# Altium project FYP_schemetics.PrjPcb
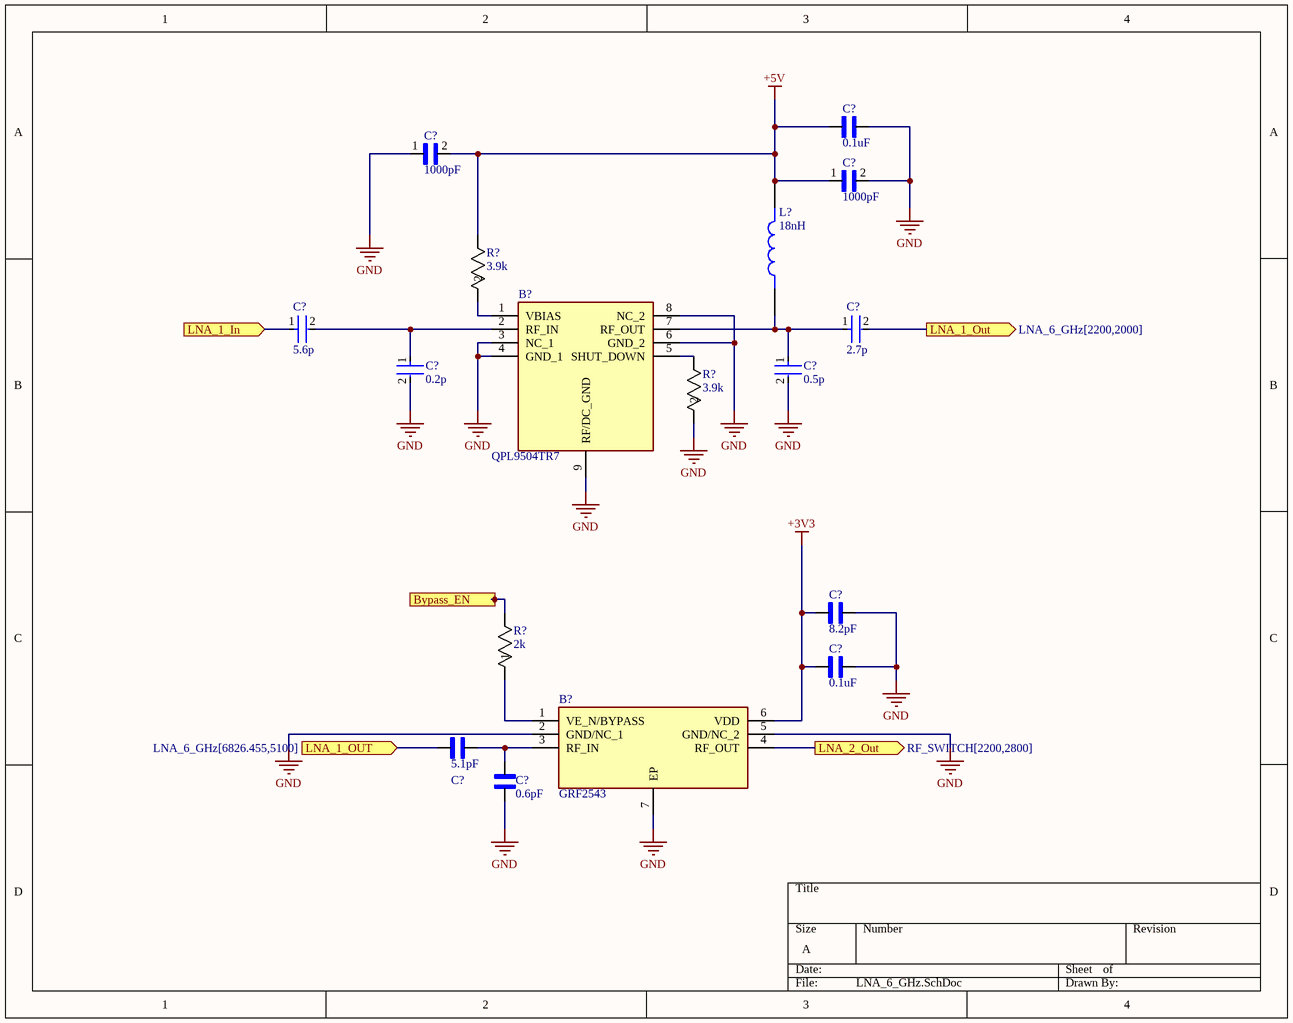
[diagram p0: LNA_6_GHz.SchDoc]
11 sheets, 127 parts. Net scope: flat (ports and power ports of the same name join across sheets).
Sheets:
  LNA_6_GHz.SchDoc
  LNA_0.8_1.6_GHz.SchDoc
  LNA_1_3_GHz.SchDoc
  RF_SWITCH.SchDoc
  IQ_DEMOD.SchDoc
  DEMOD_FILTERS.SchDoc
  IF_FILTER_AMP.SchDoc
  ADC_DRIVER.SchDoc
  ADC.SchDoc
  RF_CONNECT.SchDoc
  DIGITAL_CONNECT.SchDoc

## Sheet LNA_6_GHz.SchDoc
size A; SheetNumber: 1; SheetTotal: 11

### Parts
(Parts that share a designator on the sheet are numbered #1, #2 ... from top to bottom, then left to right.)
B?#1  QPL9504TR7  [SON50P200X200X90-9N-D]
B?#2  GRF2543  [SON50P150X150X45-7N]
C?#1  0.1uF  [CAPC1005X55N]
C?#2  1000pF  [CAPC1005X55N]
C?#3  1000pF  [CAPC1005X55N]
C?#4  5.6p  [FP-GJM155-0_05-IPC_A]
C?#5  2.7p  [FP-GJM155-0_05-IPC_A]
C?#6  0.2p  [FP-GJM155-0_05-IPC_A]
C?#7  0.5p  [FP-GJM155-0_05-IPC_A]
C?#8  8.2pF  [CAPC0603X33N]
C?#9  0.1uF  [CAPC1005X55N]
C?#10  5.1pF  [CAPC0603X33N]
C?#11  0.6pF  [CAPC0603X33N]
L?#1  18nH  [IND_0603CS-18NXJRW]
R?#1  3.9k  [RES0402_CRG_TYCO_TYC-M]
R?#2  3.9k  [RES0402_CRG_TYCO_TYC-M]
R?#3  2k  [RES_RC0201_P6XP3_YAG]

### Ports
Bypass_EN (in), LNA_1_In (in), LNA_1_OUT (in, see LNA_6_GHz[6826.455,5100]), LNA_1_Out (out, see LNA_6_GHz[2200,2000]), LNA_2_Out (out, see RF_SWITCH[2200,2800])

### Nets
+3V3: B?#2.6(VDD) C?#8.1 C?#9.1  [project net VPS]
+5V: C?#1.1 C?#2.2 C?#3.1 L?#1.2 R?#1.1
GND: B?#1.3(NC_1) B?#1.4(GND_1) B?#1.6(GND_2) B?#1.8(NC_2) B?#1.9(RF/DC_GND) B?#2.2(GND/NC_1) B?#2.5(GND/NC_2) B?#2.7(EP) C?#1.2 C?#2.1 C?#3.2 C?#6.2 C?#7.2 C?#8.2 C?#9.2 C?#11.1 R?#2.2
NetB?#1_1: B?#1.1(VBIAS) R?#1.2
NetB?#1_2: B?#1.2(RF_IN) C?#4.2 C?#6.1
NetB?#1_5: B?#1.5(SHUT_DOWN) R?#2.1
NetB?#1_7: B?#1.7(RF_OUT) C?#5.1 C?#7.1 L?#1.1
NetB?#2_1: B?#2.1(VE_N/BYPASS) R?#3.1
NetB?#2_3: B?#2.3(RF_IN) C?#10.2 C?#11.2
NetB?#2_4: B?#2.4(RF_OUT) ; port LNA_2_Out
NetC?#4_1: C?#4.1 ; port LNA_1_In
NetC?#5_2: C?#5.2 C?#10.1 ; port LNA_1_Out, port LNA_1_OUT
NetR?#3_2: R?#3.2 ; port Bypass_EN

### Library data of the parts
B?#1 = QPL9504TR7: Ultra Low Noise, Flat Gain LNA; Manufacturer_Name: Qorvo; Geometry.Height: 0.9mm; Manufacturer_Part_Number: QPL9504TR7; Mouser Part Number: 772-QPL9504TR7; Mouser Price/Stock: https://www.mouser.co.uk/ProductDetail/Qorvo/QPL9504TR7?qs=iLbezkQI%252BsiSWi8SJWi3jA%3D%3D; Arrow Part Number: *; Arrow Price/Stock: *; Datasheet Link: https://www.qorvo.com/products/d/da007934; Supplier: Avnet; Supplier Part Number: GJM1555C1H5R6CB01D
B?#2 = GRF2543: RF Amplifier High Gain, LNA with Bypass; IEEE 802.11 a/n/ac/p, 4.9 - 6.0 GHz; Manufacturer_Name: Guerrilla RF; Geometry.Height: 0.45mm; Mouser Part Number: 459-GRF2543; Mouser Price/Stock: https://www.mouser.co.uk/ProductDetail/Guerrilla-RF/GRF2543?qs=PqoDHHvF64%2FihZz%2FtUpOTQ%3D%3D; Manufacturer_Part_Number: GRF2543; Datasheet Link: https://www.guerrilla-rf.com/products/DataSheet?sku=2543&file_name=GRF2543DS.pdf
C?#1 = GRM155R61A104KA01J: 0402 0.1 uF 10 V Â±10% Tolerance X5R SMT Multilayer Ceramic Capacitor; MF: Murata Electronics; SnapEDA_Link: https://www.snapeda.com/parts/GRM155R61A104KA01J/Murata+Electronics+North+America/view-part/?ref=snap; Package: 1005-2 Murata; Value: *; MP: GRM155R61A104KA01J; Check_prices: https://www.snapeda.com/parts/GRM155R61A104KA01J/Murata+Electronics+North+America/view-part/?ref=eda
C?#2 C?#3 = C1005X7R1H102K050BA: 1000 pF Â±10% 50V Ceramic Capacitor X7R 0402 (1005 Metric); MF: TDK; Purchase-URL: https://pricing.snapeda.com/search/part/C1005X7R1H102K050BA/?ref=eda; Package: 1005 TDK; MP: C1005X7R1H102K050BA; Digi-Key_Part_Number: 445-1256-2-ND; Value: *; Check_prices: https://www.snapeda.com/parts/C1005X7R1H102K050BA/TDK/view-part/?ref=eda; SnapEDA_Link: https://www.snapeda.com/parts/C1005X7R1H102K050BA/TDK/view-part/?ref=snap
C?#4 = CMP-2008-03866-2-5.6p: Multi-Layer Ceramic Capacitor 5.6pF C0G  ±0.25pF 0402 Paper T/R; Voltage Rating: 50V; Lead Free: Lead Free; Radiation Hardening: No; Termination: SMD/SMT; Width: 0.02inch; Capacitance: 5.6pF; Thickness: 0.022inch; Depth: 0.5mm; Max Operating Temperature: 125°C; Package Quantity: 1; Case Code (Imperial): 0402; Case Code (Metric): 1005; Mount: Surface Mount; Voltage: 50V; Packaging: Tape and Reel; Length: 1mm; Voltage Rating (DC): 50V; Case/Package: 0402; Dielectric: C0G; Min Operating Temperature: -55°C; Height: 0.5mm
C?#5 = CMP-2008-03841-2-2.7p: Multi-Layer Ceramic Capacitor 2.7pF C0G  ±0.25pF 0402 Paper T/R; Voltage: 50V; Insulation Resistance: 10GR; Lead Free: Lead Free; Case Code (Metric): 1005; Min Operating Temperature: -55°C; Case Code (Imperial): 0402; Max Operating Temperature: 125°C; Thickness: 0.022inch; Voltage Rating (DC): 50V; Package Quantity: 1; Termination: SMD/SMT; Dielectric: C0G; Case/Package: 0402; Length: 1mm; Mount: Surface Mount; Height: 0.5mm; Voltage Rating: 50V; Radiation Hardening: No; Width: 0.02inch; Depth: 0.5mm; Packaging: Tape and Reel; Capacitance: 2.7pF
C?#6 = CMP-2008-03898-2-0.2p: Multi-Layer Ceramic Capacitor 0.2pF C0G  ±0.1pF 0402 Paper T/R; Voltage Rating (DC): 50V; Packaging: Tape and Reel; REACH SVHC: No SVHC; Mount: Surface Mount; Thickness: 0.022inch; Height: 0.5mm; Package Quantity: 1; Depth: 0.5mm; Max Operating Temperature: 125°C; Case Code (Imperial): 0402; Number of Pins: 2; Termination: SMD/SMT; Min Operating Temperature: -55°C; Lead Pitch: 0.3mm; Width: 0.5mm; Radiation Hardening: No; Length: 1mm; Voltage Rating: 50V; Dielectric: C0G; Case/Package: 0402; Capacitance: 0.2pF; Lead Free: Lead Free; Case Code (Metric): 1005
C?#7 = CMP-2008-03904-2-0.5p: Multi-Layer Ceramic Capacitor 0.5pF C0G  ±0.1pF 0402 Paper T/R; Voltage Rating (DC): 50V; Temperature Coefficient: 30ppm/°C; Lead Pitch: 0.3mm; Max Operating Temperature: 125°C; Thickness: 0.022inch; Termination: SMD/SMT; Depth: 0.5mm; Height: 0.5mm; Voltage Rating: 50V; Length: 1mm; Case/Package: 0402; Radiation Hardening: No; Min Operating Temperature: -55°C; Width: 0.02inch; Voltage: 50V; Number of Pins: 2; REACH SVHC: No SVHC; Case Code (Imperial): 0402; Package Quantity: 1; Mount: Surface Mount; Capacitance: 0.5pF; Dielectric: C0G; Lead Free: Lead Free; Case Code (Metric): 1005; Packaging: Tape and Reel
C?#8 = GJM0335C1H8R2BB01D-8.2p: SMD capacitor C0G(EIA) with capacitance 8.2pF Tol.0.1pF. Rated voltage 50Vdc 125C; MF: Murata Electronics; SnapEDA_Link: https://www.snapeda.com/parts/GJM0335C1H8R2BB01D/Murata/view-part/?ref=snap; Package: 0603 Taiyo Yuden; Value: *; MP: GJM0335C1H8R2BB01D; Check_prices: https://www.snapeda.com/parts/GJM0335C1H8R2BB01D/Murata/view-part/?ref=eda
C?#9 = GRM155R61A104KA01J-0.1u: 0402 0.1 uF 10 V Â±10% Tolerance X5R SMT Multilayer Ceramic Capacitor; MF: Murata Electronics; SnapEDA_Link: https://www.snapeda.com/parts/GRM155R61A104KA01J/Murata+Electronics+North+America/view-part/?ref=snap; Package: 1005-2 Murata; Value: *; MP: GRM155R61A104KA01J; Check_prices: https://www.snapeda.com/parts/GRM155R61A104KA01J/Murata+Electronics+North+America/view-part/?ref=eda
C?#10 = GJM0335C1H5R1WB01D-5.1p: SMD capacitor C0G(EIA) with capacitance 5.1pF Tol.0.05pF. Rated voltage 50Vdc 125C; MF: Murata; SnapEDA_Link: https://www.snapeda.com/parts/GJM0335C1H5R1WB01D/Murata/view-part/?ref=snap; Package: 0603 Taiyo Yuden; Value: *; MP: GJM0335C1H5R1WB01D; Check_prices: https://www.snapeda.com/parts/GJM0335C1H5R1WB01D/Murata/view-part/?ref=eda
C?#11 = GJM0335C1HR60WB01D-0.6p: SMD capacitor C0G(EIA) with capacitance 0.60pF Tol.0.05pF. Rated voltage 50Vdc 125C; MF: Murata; SnapEDA_Link: https://www.snapeda.com/parts/GJM0335C1HR60WB01D/Murata/view-part/?ref=snap; Package: 0603 Taiyo Yuden; Value: *; MP: GJM0335C1HR60WB01D; Check_prices: https://www.snapeda.com/parts/GJM0335C1HR60WB01D/Murata/view-part/?ref=eda
L?#1 = 0603CS-18NXJRW: Package: None; Price: None; Value: *; MP: 0603CS-18NXJRW; Availability: Unavailable
R?#1 R?#2 = CRG0402F3K9: CRG0402 1% 3K9; Manufacturer_Name: TE Connectivity; Copyright: Copyright (C) 2026 Ultra Librarian. All rights reserved.; Manufacturer_Part_Number: CRG0402F3K9
R?#3 = RC0201JR-072KL: No Description Available; Manufacturer_Name: Yageo; Copyright: Copyright (C) 2026 Ultra Librarian. All rights reserved.; Manufacturer_Part_Number: RC0201JR-072KL

## Sheet LNA_0.8_1.6_GHz.SchDoc
size A; SheetNumber: 2; SheetTotal: 11
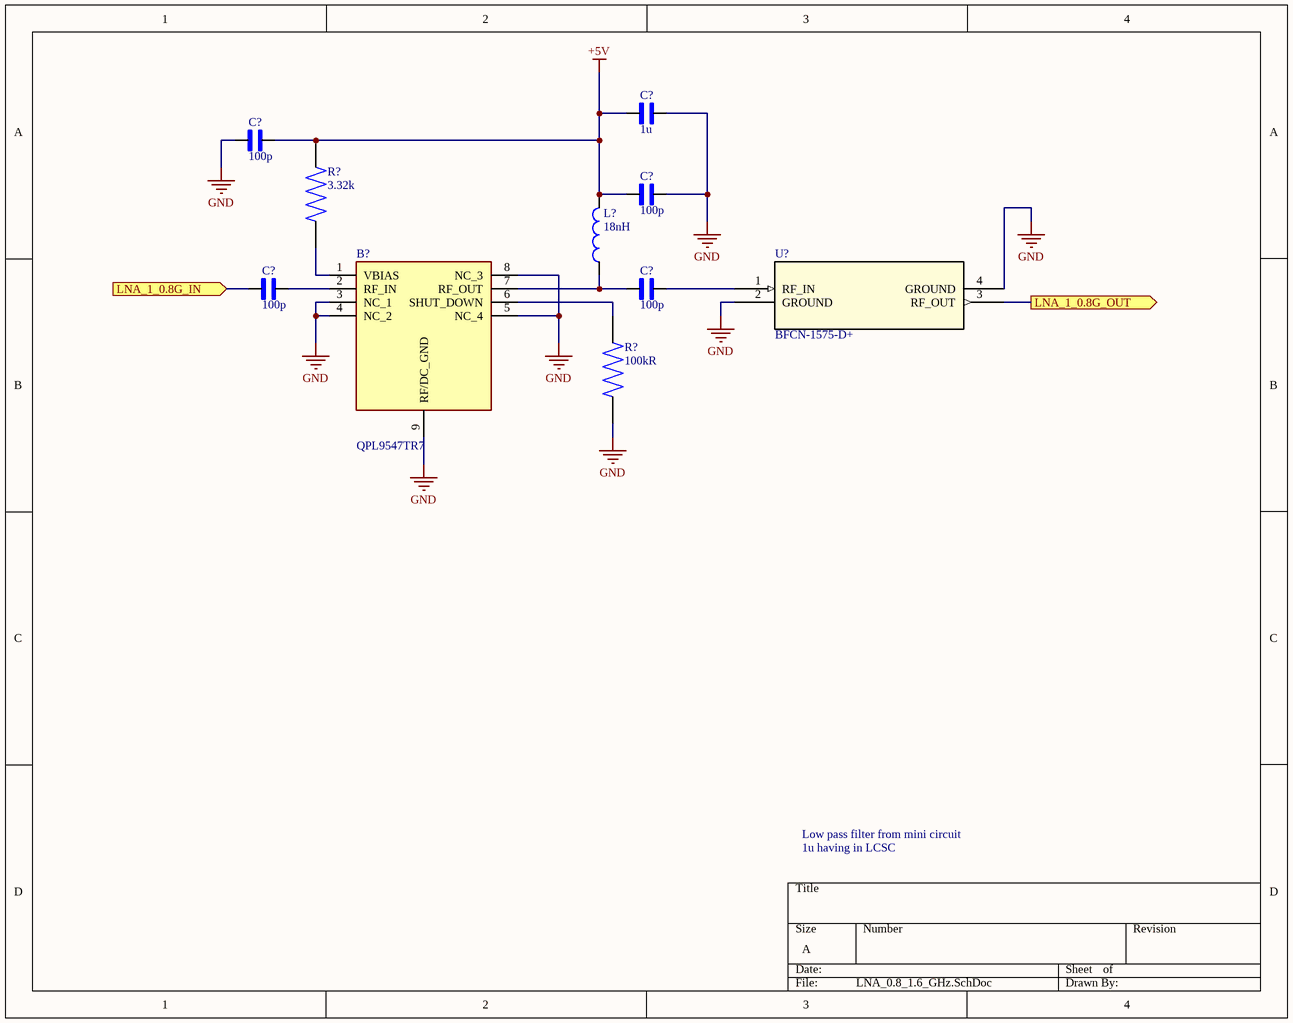
[diagram p1: LNA_0.8_1.6_GHz.SchDoc]

### Parts
(Parts that share a designator on the sheet are numbered #1, #2 ... from top to bottom, then left to right.)
B?#3  QPL9547TR7  [SON50P200X200X90-9N-D]
C?#12  1u  [CAPC1005X60N]
C?#13  100p  [CAPC1005X55N]
C?#14  100p  [CAPC1005X55N]
C?#15  100p  [CAPC1005X55N]
C?#16  100p  [CAPC1005X55N]
L?#2  18nH  [IND_0402CS-18NXGRW]
R?#4  3.32k  [RESC1005X40N]
R?#5  100kR  [RESC1005X35N]
U?#1  BFCN-1575-D+  [FV1206_MNC]

### Ports
LNA_1_0.8G_IN (in), LNA_1_0.8G_OUT (out)

### Nets
+5V: C?#12.1 C?#13.2 C?#14.1 L?#2.2 R?#4.2
GND: B?#3.3(NC_1) B?#3.4(NC_2) B?#3.5(NC_4) B?#3.8(NC_3) B?#3.9(RF/DC_GND) C?#12.2 C?#13.1 C?#14.2 R?#5.1 U?#1.2(GROUND) U?#1.4(GROUND)
NetB?#3_1: B?#3.1(VBIAS) R?#4.1
NetB?#3_2: B?#3.2(RF_IN) C?#15.2
NetB?#3_6: B?#3.6(SHUT_DOWN) R?#5.2
NetB?#3_7: B?#3.7(RF_OUT) C?#16.1 L?#2.1
NetC?#15_1: C?#15.1 ; port LNA_1_0.8G_IN
NetC?#16_2: C?#16.2 U?#1.1(RF_IN)
NetU?#1_3: U?#1.3(RF_OUT) ; port LNA_1_0.8G_OUT

### Notes on the sheet
- Low pass filter from mini circuit
- 1u having in LCSC

### Library data of the parts
B?#3 = QPL9547TR7: Ultra Low Noise, Flat Gain LNA; Manufacturer_Name: Qorvo; Geometry.Height: 0.9mm; Manufacturer_Part_Number: QPL9547TR7; Mouser Part Number: 772-QPL9504TR7; Mouser Price/Stock: https://www.mouser.com/en/ProductDetail/Qorvo/QPL9547TR7?qs=7MVldsJ5UaxZMCnAEuCHXA%3D%3D; Arrow Part Number: *; Arrow Price/Stock: *; Datasheet Link: https://www.qorvo.com/products/r/ra006121
C?#12 = GRM155C81E105KE11J-1u: SMD Capacitor X6S(EIA) with Capacitance: 1.0uF Tol. 10%. Rated Voltage: 25Vdc 402; MF: Murata; SnapEDA_Link: https://www.snapeda.com/parts/GRM155C81E105KE11J/Murata/view-part/?ref=snap; Package: 2012 Murata; Value: *; MP: GRM155C81E105KE11J; Check_prices: https://www.snapeda.com/parts/GRM155C81E105KE11J/Murata/view-part/?ref=eda
C?#13-C?#16 = UMK105CG101JV-F-100p: 100 pF Â±5% 50V Ceramic Capacitor C0G, NP0 0402 (1005 Metric); MANUFACTURER: Taiyo Yuden; Package: 1005 Taiyo Yuden; MPN: UMK105CG101JV-F; DATASHEET_URL: https://ds.yuden.co.jp/TYCOMPAS/ut/detail?pn=UMK105CG101JV-F  &u=M; Value: *; SOURCE_URL: https://www.snapeda.com/parts/UMK105CG101JV-F/Taiyo+Yuden/view-part/
L?#2 = 0402CS-18NXGRW: Package: None; Price: None; Value: *; MP: 0402CS-18NXGRW; Availability: Unavailable
R?#4 = ERJ-2RKF3321X-3.32kR: 3.32K OHM 1% 100PPM; Package: None; Price: None; Value: *; MP: ERJ-2RKF3321X; Availability: Unavailable
R?#5 = RNCF0402BKE100K-100kR: MPN: RNCF0402BKE100K; Value: *
U?#1 = BFCN-1575-D+: DC to 1575 MHz from Mini Circuit; Manufacturer_Name: Mini Circuits; Manufacturer_Part_Number: BFCN-1575+; Copyright: Copyright (C) 2026 Ultra Librarian. All rights reserved.; RefDes: RefDes; Type: Type

## Sheet LNA_1_3_GHz.SchDoc
size A; SheetNumber: 3; SheetTotal: 11
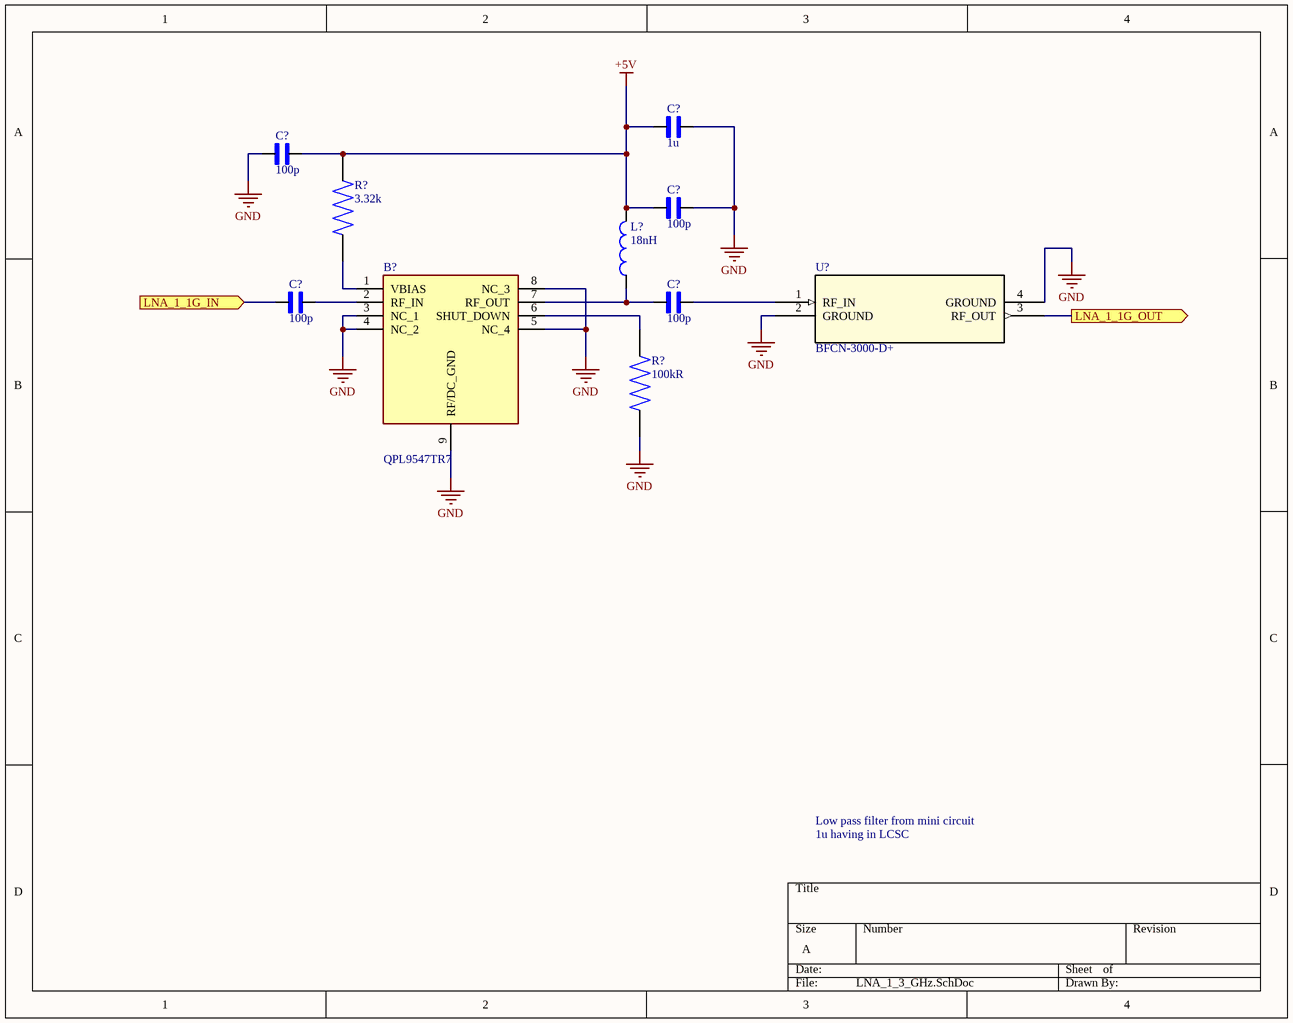
[diagram p2: LNA_1_3_GHz.SchDoc]

### Parts
(Parts that share a designator on the sheet are numbered #1, #2 ... from top to bottom, then left to right.)
B?#4  QPL9547TR7  [SON50P200X200X90-9N-D]
C?#17  1u  [CAPC1005X60N]
C?#18  100p  [CAPC1005X55N]
C?#19  100p  [CAPC1005X55N]
C?#20  100p  [CAPC1005X55N]
C?#21  100p  [CAPC1005X55N]
L?#3  18nH  [IND_0402CS-18NXGRW]
R?#6  3.32k  [RESC1005X40N]
R?#7  100kR  [RESC1005X35N]
U?#2  BFCN-3000-D+  [FV1206_MNC]

### Ports
LNA_1_1G_IN (in), LNA_1_1G_OUT (out)

### Nets
+5V: C?#17.1 C?#18.2 C?#19.1 L?#3.2 R?#6.2
GND: B?#4.3(NC_1) B?#4.4(NC_2) B?#4.5(NC_4) B?#4.8(NC_3) B?#4.9(RF/DC_GND) C?#17.2 C?#18.1 C?#19.2 R?#7.1 U?#2.2(GROUND) U?#2.4(GROUND)
NetB?#4_1: B?#4.1(VBIAS) R?#6.1
NetB?#4_2: B?#4.2(RF_IN) C?#20.2
NetB?#4_6: B?#4.6(SHUT_DOWN) R?#7.2
NetB?#4_7: B?#4.7(RF_OUT) C?#21.1 L?#3.1
NetC?#20_1: C?#20.1 ; port LNA_1_1G_IN
NetC?#21_2: C?#21.2 U?#2.1(RF_IN)
NetU?#2_3: U?#2.3(RF_OUT) ; port LNA_1_1G_OUT

### Notes on the sheet
- Low pass filter from mini circuit
- 1u having in LCSC

### Library data of the parts
B?#4 = QPL9547TR7: as B?#3 on sheet LNA_0.8_1.6_GHz; Manufacturer_Part_Number: QPL9547TR7; Mouser Part Number: 772-QPL9504TR7; Mouser Price/Stock: https://www.mouser.com/en/ProductDetail/Qorvo/QPL9547TR7?qs=7MVldsJ5UaxZMCnAEuCHXA%3D%3D; Arrow Part Number: *; Arrow Price/Stock: *; Datasheet Link: https://www.qorvo.com/products/r/ra006121
C?#17 = GRM155C81E105KE11J-1u: as C?#12 on sheet LNA_0.8_1.6_GHz; SnapEDA_Link: https://www.snapeda.com/parts/GRM155C81E105KE11J/Murata/view-part/?ref=snap; Package: 2012 Murata; Value: *; MP: GRM155C81E105KE11J; Check_prices: https://www.snapeda.com/parts/GRM155C81E105KE11J/Murata/view-part/?ref=eda
C?#18-C?#21 = UMK105CG101JV-F-100p: as C?#13 on sheet LNA_0.8_1.6_GHz; Package: 1005 Taiyo Yuden; MPN: UMK105CG101JV-F; DATASHEET_URL: https://ds.yuden.co.jp/TYCOMPAS/ut/detail?pn=UMK105CG101JV-F  &u=M; Value: *; SOURCE_URL: https://www.snapeda.com/parts/UMK105CG101JV-F/Taiyo+Yuden/view-part/
L?#3 = 0402CS-18NXGRW: Package: None; Price: None; Value: *; MP: 0402CS-18NXGRW; Availability: Unavailable
R?#6 = ERJ-2RKF3321X-3.32kR: 3.32K OHM 1% 100PPM; Package: None; Price: None; Value: *; MP: ERJ-2RKF3321X; Availability: Unavailable
R?#7 = RNCF0402BKE100K-100kR: MPN: RNCF0402BKE100K; Value: *
U?#2 = BFCN-3000-D+: DC to 3000MHz from mini circuit; Manufacturer_Name: Mini Circuits; Manufacturer_Part_Number: BFCN-1575+; Copyright: Copyright (C) 2026 Ultra Librarian. All rights reserved.; RefDes: RefDes; Type: Type

## Sheet RF_SWITCH.SchDoc
size A; SheetNumber: 5; SheetTotal: 12
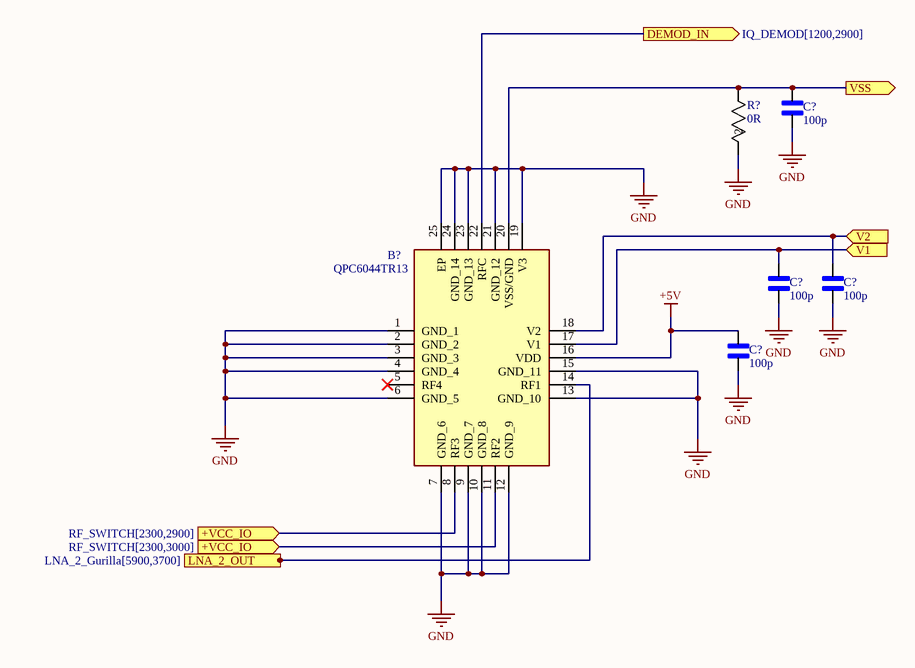
[diagram p3: RF_SWITCH.SchDoc]

### Parts
(Parts that share a designator on the sheet are numbered #1, #2 ... from top to bottom, then left to right.)
B?#5  QPC6044TR13  [QFN50P400X400X80-25N-D]
C?#22  100p  [CAPC1005X55N]
C?#23  100p  [CAPC1005X55N]
C?#24  100p  [CAPC1005X55N]
C?#25  100p  [CAPC1005X55N]
R?#8  0R  [RC0402N_PAN]

### Ports
+VCC_IO (in, see RF_SWITCH[2300,2900]), +VCC_IO (in, see RF_SWITCH[2300,3000]), DEMOD_IN (out, see IQ_DEMOD[1200,2900]), LNA_2_OUT (in, see LNA_2_Gurilla[5900,3700]), V1 (in), V2 (in), VSS (out)

### Nets
+5V: B?#5.16(VDD) C?#25.2
GND: B?#5.1(GND_1) B?#5.2(GND_2) B?#5.3(GND_3) B?#5.4(GND_4) B?#5.6(GND_5) B?#5.7(GND_6) B?#5.9(GND_7) B?#5.10(GND_8) B?#5.12(GND_9) B?#5.13(GND_10) B?#5.15(GND_11) B?#5.19(V3) B?#5.21(GND_12) B?#5.23(GND_13) B?#5.24(GND_14) B?#5.25(EP) C?#22.1 C?#23.1 C?#24.1 C?#25.1 R?#8.2
NetB?#2_4: B?#5.14(RF1) ; port LNA_2_OUT
NetB?#5_8: B?#5.8(RF3) B?#5.11(RF2) ; port +VCC_IO
NetB?#5_17: B?#5.17(V1) C?#23.2 ; port V1
NetB?#5_18: B?#5.18(V2) C?#24.2 ; port V2
NetB?#5_20: B?#5.20(VSS/GND) C?#22.2 R?#8.1 ; port VSS
NetB?#5_22: B?#5.22(RFC) ; port DEMOD_IN

Not connected (* = marked no-connect by the designer): B?#5 5(RF4)*

### Library data of the parts
B?#5 = QPC6044TR13: 5 - 6000 MHz Absorptive High Isolation SP4T Switch; Manufacturer_Name: Qorvo; Geometry.Height: 0.8mm; Mouser Part Number: 772-QPC6044TR; Mouser Price/Stock: https://www.mouser.co.uk/ProductDetail/Qorvo/QPC6044TR13?qs=AZxAKFb3YN%252BZtJBrTRUA2g%3D%3D; Manufacturer_Part_Number: QPC6044TR13; Datasheet Link: https://www.qorvo.com/products/d/da000272
C?#22-C?#25 = UMK105CG101JV-F-100p: as C?#13 on sheet LNA_0.8_1.6_GHz; Package: 1005 Taiyo Yuden; MPN: UMK105CG101JV-F; DATASHEET_URL: https://ds.yuden.co.jp/TYCOMPAS/ut/detail?pn=UMK105CG101JV-F  &u=M; Value: *; SOURCE_URL: https://www.snapeda.com/parts/UMK105CG101JV-F/Taiyo+Yuden/view-part/
R?#8 = ERJ-2GE0R00X-0R: RESISTOR; 0402; 0 OHM; 0%; JUMPER; 0.10W; THICK FILM; Manufacturer_Name: Panasonic; Copyright: Copyright (C) 2025 Ultra Librarian. All rights reserved.; Manufacturer_Part_Number: ERJ-2GE0R00X

## Sheet IQ_DEMOD.SchDoc
size A; SheetNumber: 6; SheetTotal: 12
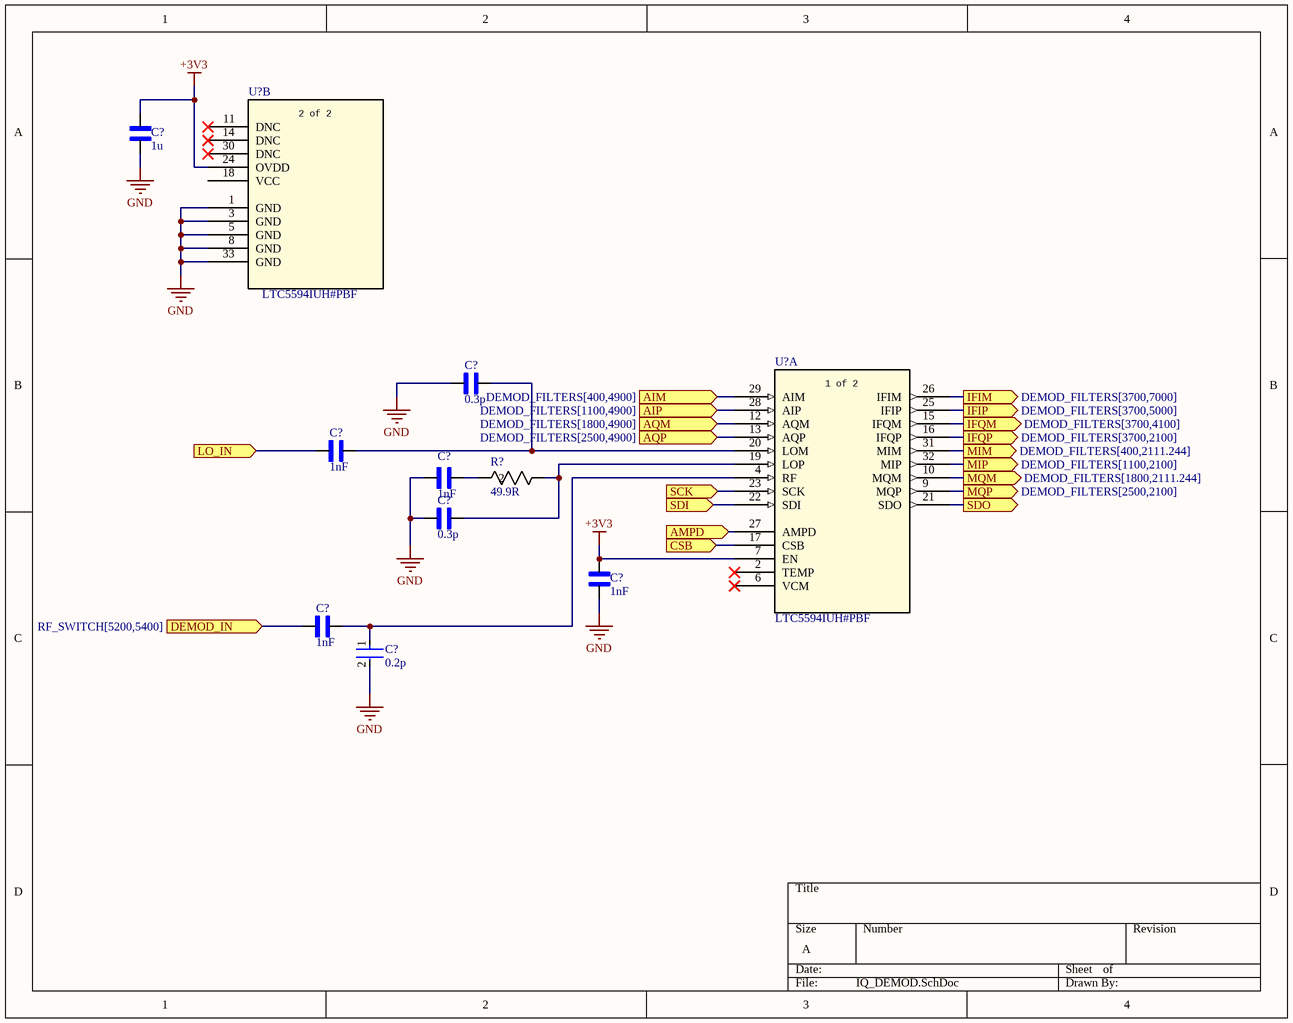
[diagram p4: IQ_DEMOD.SchDoc]

### Parts
(Parts that share a designator on the sheet are numbered #1, #2 ... from top to bottom, then left to right.)
C?#26  1u  [CAPC1608X90N]
C?#27  0.3p  [CAPC1005X55N]
C?#28  1nF  [CAPC1005X55N]
C?#29  1nF  [CAPC1005X55N]
C?#30  0.3p  [CAPC1005X55N]
C?#31  1nF  [CAPC1005X55N]
C?#32  1nF  [CAPC1005X55N]
C?#33  0.2p  [FP-GJM155-0_05-IPC_A]
R?#9  49.9R  [RC0402N_YAG]
U?#3  LTC5594IUH#PBF  [UH_05-08-1693_ADI]  (part B of 2)
U?#4  LTC5594IUH#PBF  [UH_05-08-1693_ADI]  (part A of 2)

### Ports
AIM (in, see DEMOD_FILTERS[400,4900]), AIP (in, see DEMOD_FILTERS[1100,4900]), AMPD (in), AQM (in, see DEMOD_FILTERS[1800,4900]), AQP (in, see DEMOD_FILTERS[2500,4900]), CSB (in), DEMOD_IN (in, see RF_SWITCH[5200,5400]), IFIM (out, see DEMOD_FILTERS[3700,7000]), IFIP (out, see DEMOD_FILTERS[3700,5000]), IFQM (out, see DEMOD_FILTERS[3700,4100]), IFQP (out, see DEMOD_FILTERS[3700,2100]), LO_IN (in), MIM (out, see DEMOD_FILTERS[400,2111.244]), MIP (out, see DEMOD_FILTERS[1100,2100]), MQM (out, see DEMOD_FILTERS[1800,2111.244]), MQP (out, see DEMOD_FILTERS[2500,2100]), SCK (in), SDI (in), SDO (out)

### Nets
+3V3: C?#26.2 C?#31.2 U?#3.24(OVDD) U?#4.7(EN)  [project net VPS]
GND: C?#26.1 C?#27.1 C?#29.1 C?#30.1 C?#31.1 C?#33.2 U?#3.1(GND) U?#3.3(GND) U?#3.5(GND) U?#3.8(GND) U?#3.33(GND)
NetB?#5_22: C?#32.1 ; port DEMOD_IN
NetC?#27_2: C?#27.2 C?#28.2 U?#4.20(LOM)
NetC?#28_1: C?#28.1 ; port LO_IN
NetC?#29_2: C?#29.2 R?#9.2
NetC?#30_2: C?#30.2 R?#9.1 U?#4.19(LOP)
NetC?#32_2: C?#32.2 C?#33.1 U?#4.4(RF)
NetC?#34_2: U?#4.26(IFIM) ; port IFIM
NetC?#37_1: U?#4.25(IFIP) ; port IFIP
NetC?#40_1: U?#4.29(AIM) ; port AIM
NetC?#41_2: U?#4.28(AIP) ; port AIP
NetC?#42_1: U?#4.12(AQM) ; port AQM
NetC?#43_2: U?#4.13(AQP) ; port AQP
NetC?#44_2: U?#4.15(IFQM) ; port IFQM
NetC?#47_1: U?#4.31(MIM) ; port MIM
NetC?#48_2: U?#4.32(MIP) ; port MIP
NetC?#49_1: U?#4.10(MQM) ; port MQM
NetC?#50_2: U?#4.9(MQP) ; port MQP
NetC?#51_1: U?#4.16(IFQP) ; port IFQP
NetU?#4_17: U?#4.17(CSB) ; port CSB
NetU?#4_21: U?#4.21(SDO) ; port SDO
NetU?#4_22: U?#4.22(SDI) ; port SDI
NetU?#4_23: U?#4.23(SCK) ; port SCK
NetU?#4_27: U?#4.27(AMPD) ; port AMPD

Not connected (* = marked no-connect by the designer): U?#3 11(DNC)* 14(DNC)* 18(VCC) 30(DNC)*; U?#4 2(TEMP)* 6(VCM)*

### Notes on the sheet
- (in symbol LTC5594IUHPBF, part A) 1 of 2
- (in symbol LTC5594IUHPBF, part B) 2 of 2

### Library data of the parts
C?#26 = GCM188R71E105KA64J-1u: 1 ÂµF Â±10% 25V Ceramic Capacitor X7R 0603 (1608 Metric); MF: Murata; SnapEDA_Link: https://www.snapeda.com/parts/GCM188R71E105KA64J/Murata/view-part/?ref=snap; Package: 1608-2 MURATA; Value: *; MP: GCM188R71E105KA64J; Check_prices: https://www.snapeda.com/parts/GCM188R71E105KA64J/Murata/view-part/?ref=eda
C?#27 C?#30 = GJM1555C1HR30WB01D-0.3p: 0402 0.3 pF 50V Â±0.05 pF Tolerance C0G SMT Multilayer Ceramic Capacitor; MF: Murata; SnapEDA_Link: https://www.snapeda.com/parts/GJM1555C1HR30WB01D/Murata/view-part/?ref=snap; Package: 1005 Taiyo Yuden; Value: *; MP: GJM1555C1HR30WB01D; Check_prices: https://www.snapeda.com/parts/GJM1555C1HR30WB01D/Murata/view-part/?ref=eda
C?#28 C?#29 C?#31 C?#32 = GRM1555C1H102FA01D-1n: SMD capacitor C0G(EIA) with capacitance 1000pF Tol.1%. Rated voltage 50Vdc 125C; MF: Murata; SnapEDA_Link: https://www.snapeda.com/parts/GRM1555C1H102FA01D/Murata/view-part/?ref=snap; Package: 1005-2 Murata; Value: *; MP: GRM1555C1H102FA01D; Check_prices: https://www.snapeda.com/parts/GRM1555C1H102FA01D/Murata/view-part/?ref=eda
C?#33 = CMP-2008-03898-2-0.2p: as C?#6 on sheet LNA_6_GHz; Packaging: Tape and Reel; REACH SVHC: No SVHC; Mount: Surface Mount; Thickness: 0.022inch; Height: 0.5mm; Package Quantity: 1; Depth: 0.5mm; Max Operating Temperature: 125°C; Case Code (Imperial): 0402; Number of Pins: 2; Termination: SMD/SMT; Min Operating Temperature: -55°C; Lead Pitch: 0.3mm; Width: 0.5mm; Radiation Hardening: No; Length: 1mm; Voltage Rating: 50V; Dielectric: C0G; Case/Package: 0402; Capacitance: 0.2pF; Lead Free: Lead Free; Case Code (Metric): 1005
R?#9 = RC0402FR-0749R9L-49.9R: RES, 49.9, 1%, 0.063 W, 0402; Manufacturer_Name: Yageo; Copyright: Copyright (C) 2025 Ultra Librarian. All rights reserved.; Manufacturer_Part_Number: RC0402FR-0749R9L
U?#3 U?#4 = LTC5594IUHPBF: 300MHz to 9GHz High Linearity I/Q Demodulator with Wideband IF Amplifier; Manufacturer_Name: Analog Devices Inc; Copyright: Copyright (C) 2026 Ultra Librarian. All rights reserved.; Manufacturer_Part_Number: LTC5594IUH#PBF; RefDes: RefDes; Type: Type

## Sheet DEMOD_FILTERS.SchDoc
size A; SheetNumber: 4; SheetTotal: 9
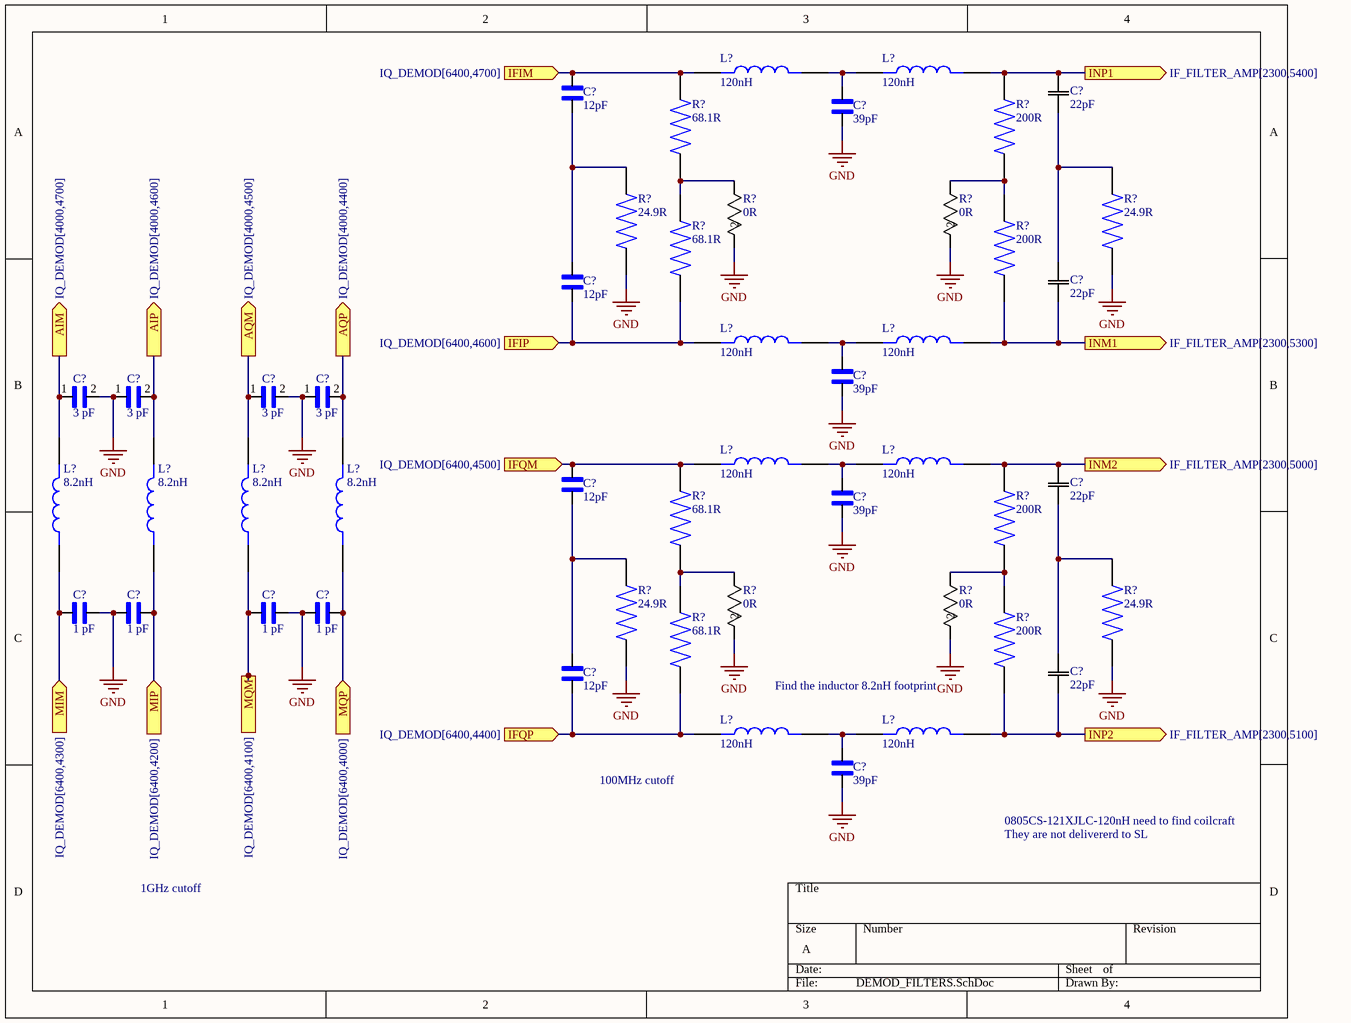
[diagram p5: DEMOD_FILTERS.SchDoc]

### Parts
(Parts that share a designator on the sheet are numbered #1, #2 ... from top to bottom, then left to right.)
C?#34  12pF  [CAPC1005X55N]
C?#35  39pF  [CAPC1005X55N]
C?#36  22pF  [G-155_MUR]
C?#37  12pF  [CAPC1005X55N]
C?#38  22pF  [G-155_MUR]
C?#39  39pF  [CAPC1005X55N]
C?#40  3 pF  [CAPC0603X33N]
C?#41  3 pF  [CAPC0603X33N]
C?#42  3 pF  [CAPC0603X33N]
C?#43  3 pF  [CAPC0603X33N]
C?#44  12pF  [CAPC1005X55N]
C?#45  39pF  [CAPC1005X55N]
C?#46  22pF  [G-155_MUR]
C?#47  1 pF  [CAPC0603X33N]
C?#48  1 pF  [CAPC0603X33N]
C?#49  1 pF  [CAPC0603X33N]
C?#50  1 pF  [CAPC0603X33N]
C?#51  12pF  [CAPC1005X55N]
C?#52  22pF  [G-155_MUR]
C?#53  39pF  [CAPC1005X55N]
L?#4  120nH
L?#5  120nH
L?#6  120nH
L?#7  120nH
L?#8  120nH
L?#9  120nH
L?#10  8.2nH
L?#11  8.2nH
L?#12  8.2nH
L?#13  8.2nH
L?#14  120nH
L?#15  120nH
R?#10  68.1R  [RESC1005X40N]
R?#11  200R  [RESC1005X40N]
R?#12  24.9R  [RESC1005X40N]
R?#13  24.9R  [RESC1005X40N]
R?#14  68.1R  [RESC1005X40N]
R?#15  0R  [RC0402N_PAN]
R?#16  0R  [RC0402N_PAN]
R?#17  200R  [RESC1005X40N]
R?#18  68.1R  [RESC1005X40N]
R?#19  200R  [RESC1005X40N]
R?#20  24.9R  [RESC1005X40N]
R?#21  24.9R  [RESC1005X40N]
R?#22  68.1R  [RESC1005X40N]
R?#23  0R  [RC0402N_PAN]
R?#24  0R  [RC0402N_PAN]
R?#25  200R  [RESC1005X40N]

### Ports
AIM (out, see IQ_DEMOD[4000,4700]), AIP (out, see IQ_DEMOD[4000,4600]), AQM (out, see IQ_DEMOD[4000,4500]), AQP (out, see IQ_DEMOD[4000,4400]), IFIM (in, see IQ_DEMOD[6400,4700]), IFIP (in, see IQ_DEMOD[6400,4600]), IFQM (in, see IQ_DEMOD[6400,4500]), IFQP (in, see IQ_DEMOD[6400,4400]), INM1 (out, see IF_FILTER_AMP[2300,5300]), INM2 (out, see IF_FILTER_AMP[2300,5000]), INP1 (out, see IF_FILTER_AMP[2300,5400]), INP2 (out, see IF_FILTER_AMP[2300,5100]), MIM (in, see IQ_DEMOD[6400,4300]), MIP (in, see IQ_DEMOD[6400,4200]), MQM (in, see IQ_DEMOD[6400,4100]), MQP (in, see IQ_DEMOD[6400,4000])

### Nets
GND: C?#35.1 C?#39.1 C?#40.2 C?#41.1 C?#42.2 C?#43.1 C?#45.1 C?#47.2 C?#48.1 C?#49.2 C?#50.1 C?#53.1 R?#12.1 R?#13.1 R?#15.2 R?#16.2 R?#20.1 R?#21.1 R?#23.2 R?#24.2
NetC?#34_1: C?#34.1 C?#37.2 R?#12.2
NetC?#34_2: C?#34.2 L?#4.1 R?#10.2 ; port IFIM
NetC?#35_2: C?#35.2 L?#4.2 L?#5.1
NetC?#36_1: C?#36.1 C?#38.2 R?#13.2
NetC?#36_2: C?#36.2 L?#5.2 R?#11.2 ; port INP1
NetC?#37_1: C?#37.1 L?#6.1 R?#14.1 ; port IFIP
NetC?#38_1: C?#38.1 L?#7.2 R?#17.1 ; port INM1
NetC?#39_2: C?#39.2 L?#6.2 L?#7.1
NetC?#40_1: C?#40.1 L?#10.2 ; port AIM
NetC?#41_2: C?#41.2 L?#11.2 ; port AIP
NetC?#42_1: C?#42.1 L?#12.2 ; port AQM
NetC?#43_2: C?#43.2 L?#13.2 ; port AQP
NetC?#44_1: C?#44.1 C?#51.2 R?#20.2
NetC?#44_2: C?#44.2 L?#8.1 R?#18.2 ; port IFQM
NetC?#45_2: C?#45.2 L?#8.2 L?#9.1
NetC?#46_1: C?#46.1 C?#52.2 R?#21.2
NetC?#46_2: C?#46.2 L?#9.2 R?#19.2 ; port INM2
NetC?#47_1: C?#47.1 L?#10.1 ; port MIM
NetC?#48_2: C?#48.2 L?#11.1 ; port MIP
NetC?#49_1: C?#49.1 L?#12.1 ; port MQM
NetC?#50_2: C?#50.2 L?#13.1 ; port MQP
NetC?#51_1: C?#51.1 L?#14.1 R?#22.1 ; port IFQP
NetC?#52_1: C?#52.1 L?#15.2 R?#25.1 ; port INP2
NetC?#53_2: C?#53.2 L?#14.2 L?#15.1
NetR?#10_1: R?#10.1 R?#14.2 R?#15.1
NetR?#11_1: R?#11.1 R?#16.1 R?#17.2
NetR?#18_1: R?#18.1 R?#22.2 R?#23.1
NetR?#19_1: R?#19.1 R?#24.1 R?#25.2

### Notes on the sheet
- Find the inductor 8.2nH footprint
- 100MHz cutoff
- 0805CS-121XJLC-120nH need to find coilcraft
- They are not delivererd to SL
- 1GHz cutoff

### Library data of the parts
C?#34 C?#37 C?#44 C?#51 = GRM1555C1H120JA01D-12p: SMD Capacitor C0G(EIA) with Capacitance: 12pF Tol. 5%. Rated Voltage: 50Vdc; MF: Murata; SnapEDA_Link: https://www.snapeda.com/parts/GRM1555C1H120JA01D/Murata/view-part/?ref=snap; Package: 1005-2 Murata; Value: *; MP: GRM1555C1H120JA01D; Check_prices: https://www.snapeda.com/parts/GRM1555C1H120JA01D/Murata/view-part/?ref=eda
C?#35 C?#39 C?#45 C?#53 = GRM1555C1H390JA01D-39p: SMD Capacitor C0G(EIA) with Capacitance: 39pF Tol. 5%. Rated Voltage: 50Vdc; MF: Murata; SnapEDA_Link: https://www.snapeda.com/parts/GRM1555C1H390JA01D/Murata/view-part/?ref=snap; Package: 1005-2 Murata; Value: *; MP: GRM1555C1H390JA01D; Check_prices: https://www.snapeda.com/parts/GRM1555C1H390JA01D/Murata/view-part/?ref=eda
C?#36 C?#38 C?#46 C?#52 = GRM1555C1H220JA01D-22p: Description; Manufacturer_Name: Murata; Copyright: Copyright (C) 2026 Ultra Librarian. All rights reserved.; Manufacturer_Part_Number: GRM1555C1H220JA01D
C?#40-C?#43 = GRM0335C1H3R0BA01D-3p: SMD capacitor C0G(EIA) with capacitance 3.0pF Tol.0.1pF. Rated voltage 50Vdc 125C; MF: Murata; SnapEDA_Link: https://www.snapeda.com/parts/GRM0335C1H3R0BA01D/Murata/view-part/?ref=snap; Purchase-URL: https://pricing.snapeda.com/search/part/GRM0335C1H3R0BA01D/?ref=eda; MP: GRM0335C1H3R0BA01D; Value: *; Package: 0603 Taiyo Yuden; Digi-Key_Part_Number: 490-11327-1-ND; Check_prices: https://www.snapeda.com/parts/GRM0335C1H3R0BA01D/Murata/view-part/?ref=eda
C?#47-C?#50 = GRM0335C1H1R0BA01J-1p: SMD capacitor C0G(EIA) with capacitance 1.0pF Tol.0.1pF. Rated voltage 50Vdc 125C; MF: Murata; SnapEDA_Link: https://www.snapeda.com/parts/GRM0335C1H1R0BA01J/Murata/view-part/?ref=snap; Package: 0603 Murata; Value: *; MP: GRM0335C1H1R0BA01J; Check_prices: https://www.snapeda.com/parts/GRM0335C1H1R0BA01J/Murata/view-part/?ref=eda
L?#4-L?#9 L?#14 L?#15 = 0805CS-121XJLC-120nH: MP: 0603CS-18NXJRW; Package: None; Price: None; Value: *; Availability: Unavailable
L?#10-L?#13 = 0805CS-080XJRC-8.2nH: MP: 0603CS-18NXJRW; Package: None; Price: None; Value: *; Availability: Unavailable
R?#10 R?#14 R?#18 R?#22 = RC0402FR-0768R1L-68.1R: 68.1 Ohms Â±1% 0.063W, 1/16W Chip Resistor 0402 (1005 Metric) Moisture Resistant Thick Film; MF: Yageo; SnapEDA_Link: https://www.snapeda.com/parts/RC0402FR-0768R1L/Yageo/view-part/?ref=snap; Package: 1005 Panasonic Electronic Components; Value: *; MP: RC0402FR-0768R1L; Check_prices: https://www.snapeda.com/parts/RC0402FR-0768R1L/Yageo/view-part/?ref=eda
R?#11 R?#17 R?#19 R?#25 = RC0402FR-07200RP-200R: 200 Ohms Â±1% 0.063W, 1/16W Chip Resistor 0402 (1005 Metric) Moisture Resistant Thick Film; MF: Yageo; SnapEDA_Link: https://www.snapeda.com/parts/RC0402FR-07200RP/Yageo/view-part/?ref=snap; Package: 1005 Panasonic Electronic Components; Value: *; MP: RC0402FR-07200RP; Check_prices: https://www.snapeda.com/parts/RC0402FR-07200RP/Yageo/view-part/?ref=eda
R?#12 R?#13 R?#20 R?#21 = RC0402FR-0724R9P-24.9R: RES SMD 24.9 OHM 1% 1/16W 0402; Package: None; Price: None; Value: *; MP: RC0402FR-0724R9P; Availability: Unavailable
R?#15 R?#16 R?#23 R?#24 = ERJ-2GE0R00X-0R: as R?#8 on sheet RF_SWITCH; Copyright: Copyright (C) 2025 Ultra Librarian. All rights reserved.; Manufacturer_Part_Number: ERJ-2GE0R00X

## Sheet IF_FILTER_AMP.SchDoc
size A; SheetNumber: 5; SheetTotal: 9
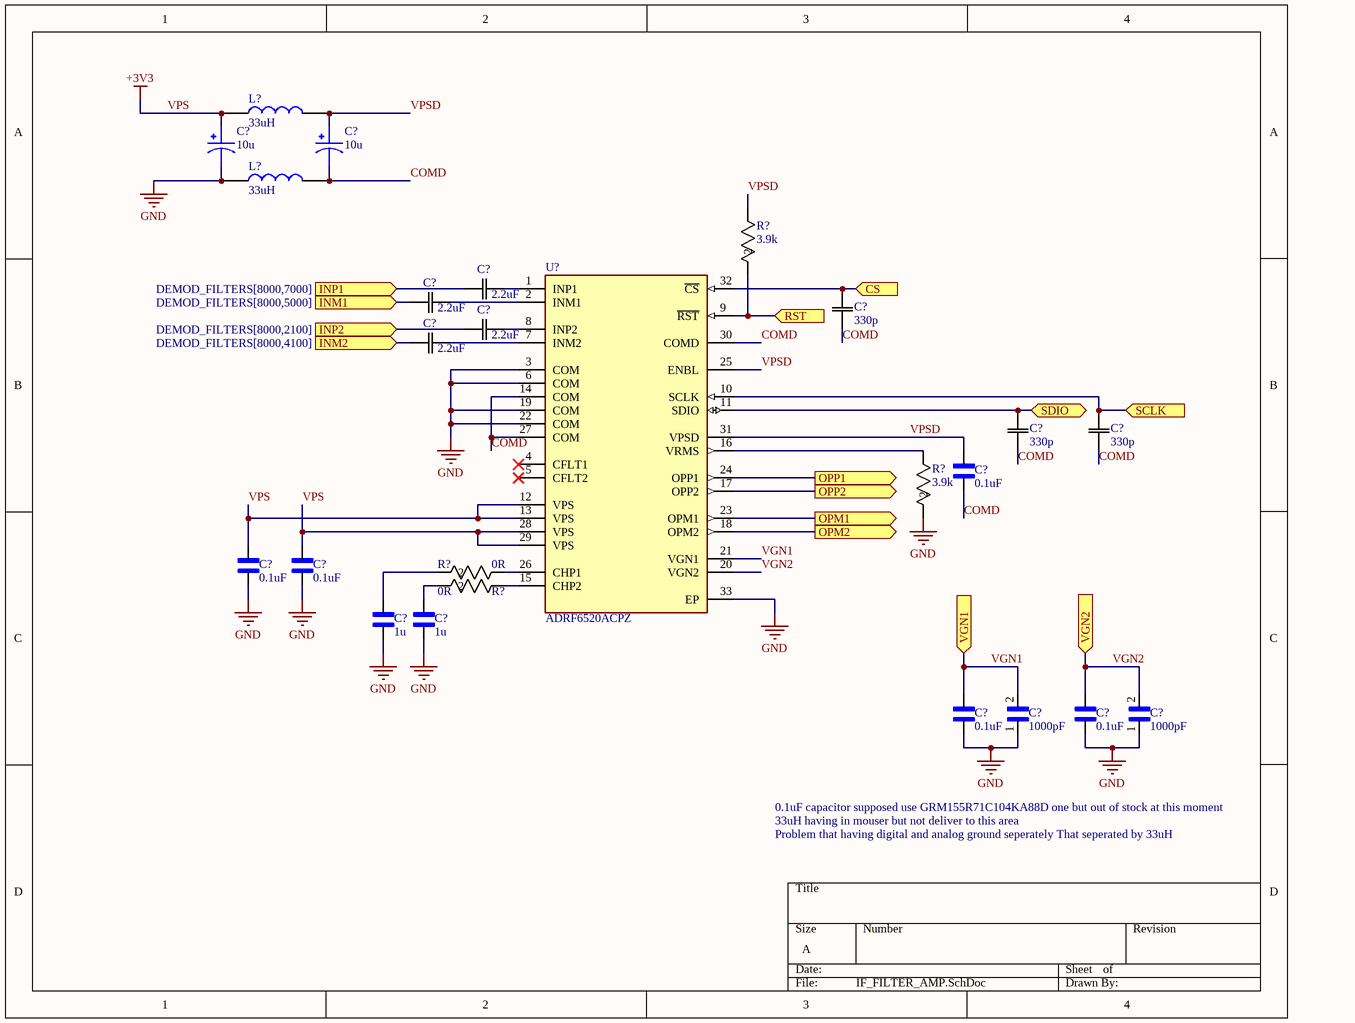
[diagram p6: IF_FILTER_AMP.SchDoc]

### Parts
(Parts that share a designator on the sheet are numbered #1, #2 ... from top to bottom, then left to right.)
C?#54  10u  [CAPPM3528X210N]
C?#55  10u  [CAPPM3528X210N]
C?#56  2.2uF  [CAP_GRM155Z_MUR]
C?#57  2.2uF  [CAP_GRM155Z_MUR]
C?#58  2.2uF  [CAP_GRM155Z_MUR]
C?#59  330p  [G-155_MUR]
C?#60  2.2uF  [CAP_GRM155Z_MUR]
C?#61  330p  [G-155_MUR]
C?#62  330p  [G-155_MUR]
C?#63  0.1uF  [CAPC1005X55N]
C?#64  0.1uF  [CAPC1005X55N]
C?#65  0.1uF  [CAPC1005X55N]
C?#66  1u  [CAPC1608X90N]
C?#67  1u  [CAPC1608X90N]
C?#68  0.1uF  [CAPC1005X55N]
C?#69  1000pF  [CAPC1005X55N]
C?#70  0.1uF  [CAPC1005X55N]
C?#71  1000pF  [CAPC1005X55N]
L?#16  33uH  [INDC5038X343N]
L?#17  33uH  [INDC5038X343N]
R?#26  3.9k  [RES0402_CRG_TYCO_TYC-M]
R?#27  3.9k  [RES0402_CRG_TYCO_TYC-M]
R?#28  0R  [RC0402N_PAN]
R?#29  0R  [RC0402N_PAN]
U?#5  ADRF6520ACPZ  [FP-CP-32-12-IPC_A]

### Ports
CS (in), INM1 (in, see DEMOD_FILTERS[8000,5000]), INM2 (in, see DEMOD_FILTERS[8000,4100]), INP1 (in, see DEMOD_FILTERS[8000,7000]), INP2 (in, see DEMOD_FILTERS[8000,2100]), OPM1 (out), OPM2 (out), OPP1 (out), OPP2 (out), RST (in), SCLK (in), SDIO (bidir), VGN1 (in), VGN2 (in)

### Nets
GND: C?#54.2 C?#64.1 C?#65.1 C?#66.1 C?#67.1 C?#68.1 C?#69.1 C?#70.1 C?#71.1 L?#17.1 R?#27.2 U?#5.3(COM) U?#5.6(COM) U?#5.19(COM) U?#5.22(COM) U?#5.33(EP)
VPS: C?#54.1 C?#64.2 C?#65.2 L?#16.1 U?#5.12(VPS) U?#5.13(VPS) U?#5.28(VPS) U?#5.29(VPS)  [also labelled +3V3]
COMD: C?#55.2 C?#59.1 C?#61.1 C?#62.1 C?#63.1 L?#17.2 U?#5.14(COM) U?#5.27(COM) U?#5.30(COMD)
VGN1: C?#68.2 C?#69.2 U?#5.21(VGN1) ; port VGN1
VGN2: C?#70.2 C?#71.2 U?#5.20(VGN2) ; port VGN2
VPSD: C?#55.1 C?#63.2 L?#16.2 R?#26.1 U?#5.25(ENBL) U?#5.31(VPSD)
NetC?#36_2: C?#56.1 ; port INP1
NetC?#38_1: C?#57.1 ; port INM1
NetC?#46_2: C?#60.1 ; port INM2
NetC?#52_1: C?#58.1 ; port INP2
NetC?#56_2: C?#56.2 U?#5.1(INP1)
NetC?#57_2: C?#57.2 U?#5.2(INM1)
NetC?#58_2: C?#58.2 U?#5.8(INP2)
NetC?#59_2: C?#59.2 U?#5.32(~{CS}) ; port CS
NetC?#60_2: C?#60.2 U?#5.7(INM2)
NetC?#61_2: C?#61.2 U?#5.11(SDIO) ; port SDIO
NetC?#62_2: C?#62.2 U?#5.10(SCLK) ; port SCLK
NetC?#66_2: C?#66.2 R?#28.2
NetC?#67_2: C?#67.2 R?#29.2
NetR?#26_2: R?#26.2 U?#5.9(~{RST}) ; port RST
NetR?#27_1: R?#27.1 U?#5.16(VRMS)
NetR?#28_1: R?#28.1 U?#5.26(CHP1)
NetR?#29_1: R?#29.1 U?#5.15(CHP2)
NetU?#5_17: U?#5.17(OPP2) ; port OPP2
NetU?#5_18: U?#5.18(OPM2) ; port OPM2
NetU?#5_23: U?#5.23(OPM1) ; port OPM1
NetU?#5_24: U?#5.24(OPP1) ; port OPP1

Not connected (* = marked no-connect by the designer): U?#5 4(CFLT1)* 5(CFLT2)*

### Notes on the sheet
- 0.1uF capacitor supposed use GRM155R71C104KA88D one but out of stock at this moment
- 33uH having in mouser but not deliver to this area
- Problem that having digital and analog ground seperately That seperated by 33uH

### Library data of the parts
C?#54 C?#55 = TAJB106K016RNJ-10u: Cap Tant Solid 10uF 16V B CASE 10% (3.5 X 2.8 X 1.9mm) Inward L SMD 3528-21 2.8 Ohm 125Â°C T/R; MF: KYOCERA AVX; SnapEDA_Link: https://www.snapeda.com/parts/TAJB106K016RNJ/Kyocera/view-part/?ref=snap; Package: Package; Value: *; MP: TAJB106K016RNJ; Check_prices: https://www.snapeda.com/parts/TAJB106K016RNJ/Kyocera/view-part/?ref=eda
C?#56-C?#58 C?#60 = GRM155Z71A225KE01D-2.2u: 2.2 µF ±10% 10V Ceramic Capacitor X7R 0402 (1005 Metric); Manufacturer_Name: Murata; Copyright: Copyright (C) 2026 Ultra Librarian. All rights reserved.; Manufacturer_Part_Number: GRM155Z71A225KE01D
C?#59 C?#61 C?#62 = GRM1555C1H331JA01D-330p: Description; Manufacturer_Name: Murata; Copyright: Copyright (C) 2025 Ultra Librarian. All rights reserved.; Manufacturer_Part_Number: GRM1555C1H331JA01D
C?#63-C?#65 C?#68 C?#70 = GRM155R61A104KA01J-0.1u: as C?#9 on sheet LNA_6_GHz; SnapEDA_Link: https://www.snapeda.com/parts/GRM155R61A104KA01J/Murata+Electronics+North+America/view-part/?ref=snap; Package: 1005-2 Murata; Value: *; MP: GRM155R61A104KA01J; Check_prices: https://www.snapeda.com/parts/GRM155R61A104KA01J/Murata+Electronics+North+America/view-part/?ref=eda
C?#66 C?#67 = GCM188R71E105KA64J-1u: as C?#26 on sheet IQ_DEMOD; SnapEDA_Link: https://www.snapeda.com/parts/GCM188R71E105KA64J/Murata/view-part/?ref=snap; Package: 1608-2 MURATA; Value: *; MP: GCM188R71E105KA64J; Check_prices: https://www.snapeda.com/parts/GCM188R71E105KA64J/Murata/view-part/?ref=eda
C?#69 C?#71 = C1005X7R1H102K050BA-1n: 1000 pF Â±10% 50V Ceramic Capacitor X7R 0402 (1005 Metric); MF: TDK; Purchase-URL: https://pricing.snapeda.com/search/part/C1005X7R1H102K050BA/?ref=eda; Package: 1005 TDK; MP: C1005X7R1H102K050BA; Digi-Key_Part_Number: 445-1256-2-ND; Value: *; Check_prices: https://www.snapeda.com/parts/C1005X7R1H102K050BA/TDK/view-part/?ref=eda; SnapEDA_Link: https://www.snapeda.com/parts/C1005X7R1H102K050BA/TDK/view-part/?ref=snap
L?#16 L?#17 = 1812CS-333XJLB-33uH: Fixed Inductors 1812CS AEC-Q200 33 uH 5 % 0.15 A; Manufacturer_Name: COILCRAFT; Geometry.Height: 3.43mm; Mouser Part Number: 994-1812CS-333XJLB; Mouser Price/Stock: https://www.mouser.com/Search/Refine.aspx?Keyword=994-1812CS-333XJLB; Manufacturer_Part_Number: 1812CS-333XJLB; Datasheet Link: https://componentsearchengine.com/Datasheets/1/1812CS-333XJLB.pdf
R?#26 R?#27 = CRG0402F3K9: as R?#1 on sheet LNA_6_GHz; Copyright: Copyright (C) 2026 Ultra Librarian. All rights reserved.; Manufacturer_Part_Number: CRG0402F3K9
R?#28 R?#29 = ERJ-2GE0R00X-0R: as R?#8 on sheet RF_SWITCH; Copyright: Copyright (C) 2025 Ultra Librarian. All rights reserved.; Manufacturer_Part_Number: ERJ-2GE0R00X
U?#5 = ADRF6520: IC RF AMP 1.25GHZ 32LFCSP; Noise Figure: 10.5dB; P1dB: 14dBm; Gain: 53dB; Frequency: 2GHz; Operating Supply Current: 425mA; Packaging: Tray; Number of Pins: 32; Test Frequency: 2GHz

## Sheet ADC_DRIVER.SchDoc
size A; SheetNumber: 7; SheetTotal: 7

## Sheet ADC.SchDoc
size A; SheetNumber: 6; SheetTotal: 6

## Sheet RF_CONNECT.SchDoc
size A; SheetNumber: 8; SheetTotal: 8

## Sheet DIGITAL_CONNECT.SchDoc
size A; SheetNumber: 9; SheetTotal: 9

## Nets that join several sheets
+5V: LNA_6_GHz (5 pins), LNA_0.8_1.6_GHz (5 pins), LNA_1_3_GHz (5 pins), RF_SWITCH (B?#5.16 C?#25.2)
GND: LNA_6_GHz (17 pins), LNA_0.8_1.6_GHz (11 pins), LNA_1_3_GHz (11 pins), RF_SWITCH (21 pins), IQ_DEMOD (11 pins), DEMOD_FILTERS (20 pins), IF_FILTER_AMP (16 pins)
VPS: LNA_6_GHz (B?#2.6 C?#8.1 C?#9.1), IQ_DEMOD (C?#26.2 C?#31.2 U?#3.24 U?#4.7), IF_FILTER_AMP (8 pins)
NetB?#2_4: LNA_6_GHz (B?#2.4), RF_SWITCH (B?#5.14)
NetB?#5_22: RF_SWITCH (B?#5.22), IQ_DEMOD (C?#32.1)
NetC?#34_2: IQ_DEMOD (U?#4.26), DEMOD_FILTERS (C?#34.2 L?#4.1 R?#10.2)
NetC?#36_2: DEMOD_FILTERS (C?#36.2 L?#5.2 R?#11.2), IF_FILTER_AMP (C?#56.1)
NetC?#37_1: IQ_DEMOD (U?#4.25), DEMOD_FILTERS (C?#37.1 L?#6.1 R?#14.1)
NetC?#38_1: DEMOD_FILTERS (C?#38.1 L?#7.2 R?#17.1), IF_FILTER_AMP (C?#57.1)
NetC?#40_1: IQ_DEMOD (U?#4.29), DEMOD_FILTERS (C?#40.1 L?#10.2)
NetC?#41_2: IQ_DEMOD (U?#4.28), DEMOD_FILTERS (C?#41.2 L?#11.2)
NetC?#42_1: IQ_DEMOD (U?#4.12), DEMOD_FILTERS (C?#42.1 L?#12.2)
NetC?#43_2: IQ_DEMOD (U?#4.13), DEMOD_FILTERS (C?#43.2 L?#13.2)
NetC?#44_2: IQ_DEMOD (U?#4.15), DEMOD_FILTERS (C?#44.2 L?#8.1 R?#18.2)
NetC?#46_2: DEMOD_FILTERS (C?#46.2 L?#9.2 R?#19.2), IF_FILTER_AMP (C?#60.1)
NetC?#47_1: IQ_DEMOD (U?#4.31), DEMOD_FILTERS (C?#47.1 L?#10.1)
NetC?#48_2: IQ_DEMOD (U?#4.32), DEMOD_FILTERS (C?#48.2 L?#11.1)
NetC?#49_1: IQ_DEMOD (U?#4.10), DEMOD_FILTERS (C?#49.1 L?#12.1)
NetC?#50_2: IQ_DEMOD (U?#4.9), DEMOD_FILTERS (C?#50.2 L?#13.1)
NetC?#51_1: IQ_DEMOD (U?#4.16), DEMOD_FILTERS (C?#51.1 L?#14.1 R?#22.1)
NetC?#52_1: DEMOD_FILTERS (C?#52.1 L?#15.2 R?#25.1), IF_FILTER_AMP (C?#58.1)